# Altium schematic sheet 40_CANFD.SchDoc
size A4; SheetNumber: 9; SheetTotal: 16
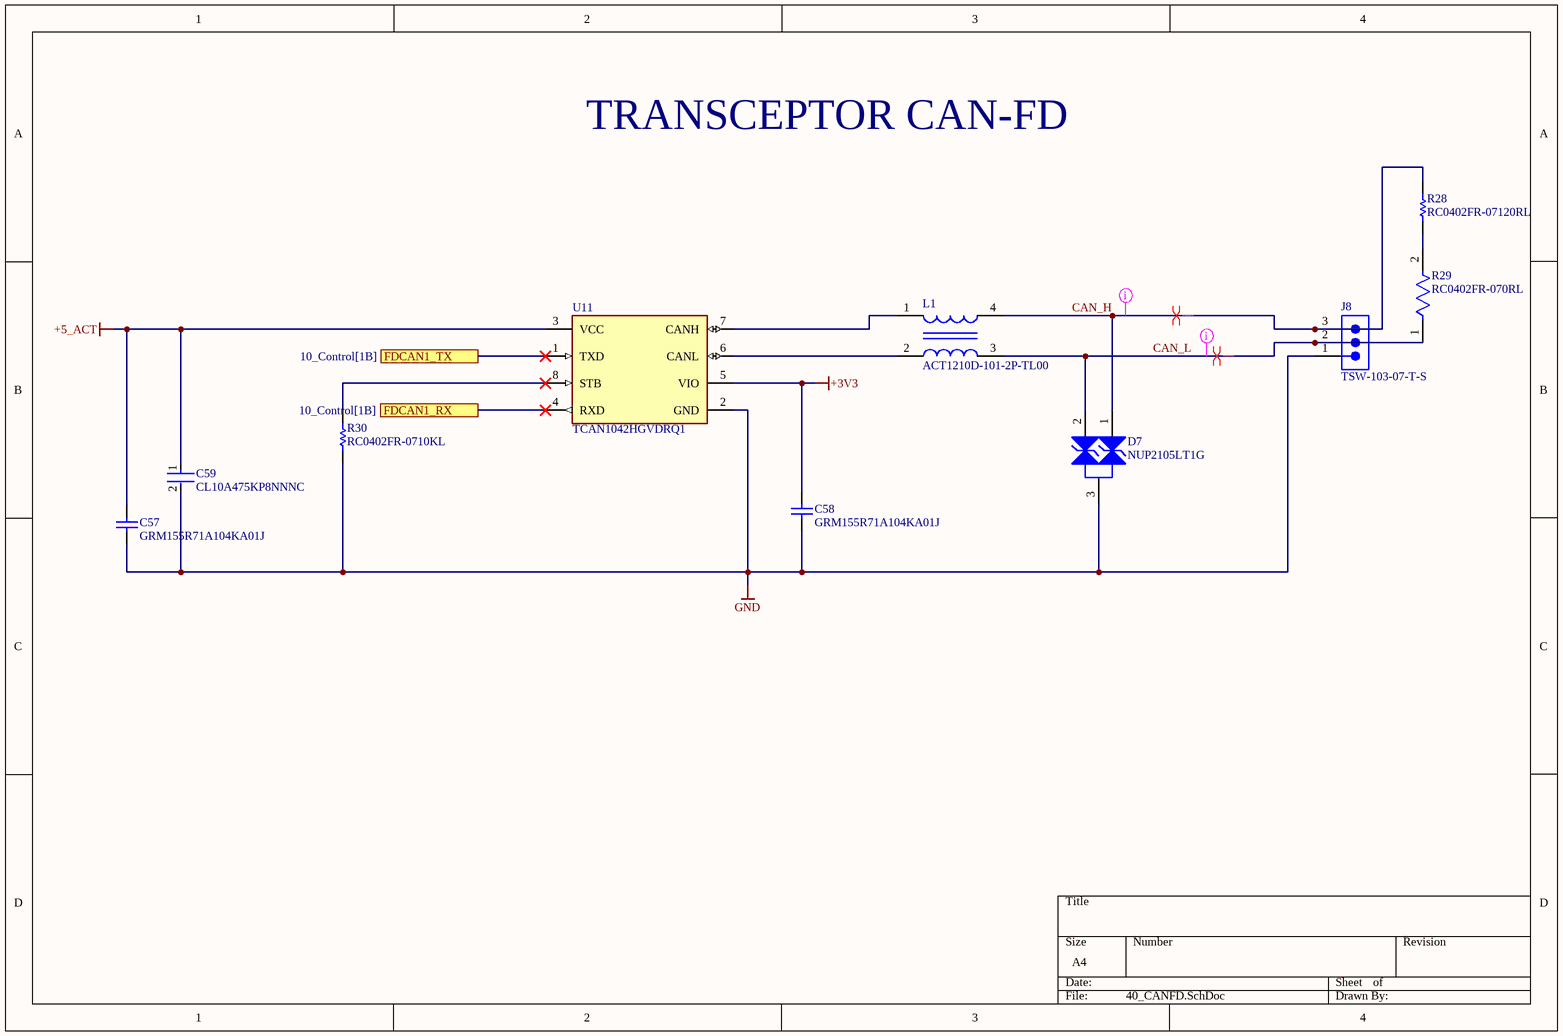
[diagram p0: 40_CANFD.SchDoc]

## Parts
C57  GRM155R71A104KA01J  [CAPC1005X55X25ML05T10]
C58  GRM155R71A104KA01J  [CAPC1005X55X25ML05T10]
C59  CL10A475KP8NNNC  [FP-CL10-IPC_C]
D7  NUP2105LT1G  [ONSC-SOT-23-3-318-08_V]
J8  TSW-103-07-T-S  [SMTC-TSW-103-07-X-S]
L1  ACT1210D-101-2P-TL00  [FP-ACT1210D-MFG]
R28  RC0402FR-07120RL  [RESC1005X40X25NL05T10]
R29  RC0402FR-070RL  [FP-RC0402-0_4-IPC_A]
R30  RC0402FR-0710KL  [RESC1005X40X25LL05T10]
U11  TCAN1042HGVDRQ1  [FP-D0008B-IPC_A]

## Ports
FDCAN1_RX (see 10_Control[1B]), FDCAN1_TX (see 10_Control[1B])

## Nets
+3V3: C58.2 U11.5(VIO)
+5_ACT: C57.2 C59.1 U11.3(VCC)
GND: C57.1 C58.1 C59.2 D7.3(K) J8.1 R30.1 U11.2(GND)
CAN_H: D7.1(K) J8.3 L1.4 R28.2
CAN_L: D7.2(K) J8.2 L1.3 R29.1
FDCAN1_RX: U11.4(RXD) ; port FDCAN1_RX
FDCAN1_TX: U11.1(TXD) ; port FDCAN1_TX
NetL1_1: L1.1 U11.7(CANH)
NetL1_2: L1.2 U11.6(CANL)
NetR28_1: R28.1 R29.2
NetR30_2: R30.2 U11.8(STB)

## Layout directives
net class CANFD_BUS: CAN_H, CAN_L
differential pair; differential pair class *: CAN_H
differential pair: CAN_L

## Notes on the sheet
- TRANSCEPTOR CAN-FD

## Library data of the parts
C57 C58 = CMP-2008-04031-1: Manufacturer: Murata; Part Number: GRM155R71A104KA01J
C59 = CMP-13271-003017-1: Cap Ceramic 4.7uF 10V X5R ±10% Pad SMD 0603 +85°C T/R; Capacitance: 4.7uF; Case/Package: 0603; Packaging: Tape and Reel; Width: 0.031inch; Contact Plating: Tin; Thickness: 0.035inch; Package Quantity: 1; Voltage Rating: 10V; Case Code (Metric): 1608; Case Code (Imperial): 0603; Depth: 0.8mm; Height: 0.8mm; Tolerance: 10%; Max Operating Temperature: 85°C; Length: 1.6mm; Dielectric: X5R; Mount: Surface Mount; Radiation Hardening: No; Min Operating Temperature: -55°C
D7 = CMP-1063-00164-1: Dual Line CAN Bus Protector, 3-Pin SOT-23, Pb-Free, Tape and Reel; Manufacturer: On Semiconductor; IR Max (uA): 0.1; Number of Lines: 2; Direction: Bidirectional; C Max (pF): 30; PPK Max (W): 350; V(BR) Min (V): 26.2; ComponentLink3URL: http://www.onsemi.cn/pub_link/Collateral/318-08.PDF; Mounting Technology: Surface Mount; ComponentLink2Description: Datasheet; PartNumber: NUP2105LT1G; ComponentLink1URL: http://www.onsemi.com/; PackageVersion: Rev. AP, 11/2009; DatasheetVersion: Rev. 5; RoHS: Pb-Free; PackageReference: SOT-23-3-318-08; ComponentLink2URL: http://www.onsemi.cn/pub_link/Collateral/NUP2105L-D.PDF; ComponentLink1Description: Manufacturer URL; PackageDescription: 3-Pin Small Outline Transistor, Body 2.92 x 1.3 mm, Pitch 0.95 mm; Packing: Tape and Reel; ComponentLink3Description: Package Specification
J8 = CMP-1024-00332-1: 0.025" SQ Post Header, Through-hole, Vertical, -55 to 105 degC, 2.54 mm Pitch, 3-Pin, Male, RoHS; Manufacturer: Samtec; Pitch: 2.54 mm; ComponentLink1URL: http://www.samtec.com; ComponentLink3URL: http://www.samtec.com/documents/webfiles/cpdf/TSW-XXX-XX-XXX-X-XX-XXX-MKT.pdf; PartNumber: TSW-103-07-T-S; Mounting Technology: Through-hole; RoHS: True; DatasheetVersion: F-214; PackageVersion: DM, 8/1988; Temperature Range: -55 to 105 degC; ComponentLink2Description: Datasheet; ComponentLink1Description: Manufacturer URL; Orientation: Vertical; PackageReference: TSW-103-07-X-S; ComponentLink3Description: Package Specification; ComponentLink2URL: http://www.samtec.com/documents/webfiles/pdf/TSW_TH.PDF; PackageDescription: .025[0.64] SQ. Post Terminal Strip Assembly
L1 = CMP-08256-000008-1: CMC 100UH 150MA 2LN SMD AEC-Q200
R28 = CMP-2002-07370-1: Manufacturer: Yageo / Phycomp; Part Number: RC0402FR-07120RL
R29 = CMP-2002-07342-2: RES SMD 0 OHM JUMPER 1/16W 0402; Resistance: 0R; Temperature Coefficient: 200ppm/°C; Tolerance: 1%; Power Rating: 62.5mW; Voltage Rating: 50V; Max Power Dissipation: 63mW; Features: Moisture Resistant; Length: 1mm; Case Code (Metric): 1005; Series: RC; RoHS Compliant: Yes; Resistor Type: Thick Film; Height: 0.35mm; Min Operating Temperature: -55°C; Case Code (Imperial): 0402; Number of Terminations: 2; Contact Plating: Tin; Case/Package: 0402; Size Code: 0402; Termination: SMD/SMT; Max Operating Temperature: 155°C; Width: 0.5mm; Mount: Surface Mount; Lead Free: Lead Free; Packaging: Tape and Reel; Radiation Hardening: No
R30 = CMP-2002-07353-1: Manufacturer: Yageo / Phycomp; Part Number: RC0402FR-0710KL
U11 = CMP-04872-000094-1: IC TRANSCEIVER 1/1 8SOIC; Max Supply Voltage: 5.5V; Number of Transmit Buffers: 1; Min Supply Voltage: 4.5V; Receiver Hysteresis: 120mV; Data Rate: 5Mbps; Mount: Surface Mount; Number of Pins: 8; Lead Free: Lead Free; Case/Package: SOIC; Min Operating Temperature: -55°C; RoHS Compliant: Yes; Max Operating Temperature: 125°C; Packaging: Cut Tape; Number of Receive Buffers: 1; REACH SVHC: No SVHC